# EAGLE design mbc_88_24_01_06_dc (EAGLE 7.6.0)

## Sheet 1 of 2
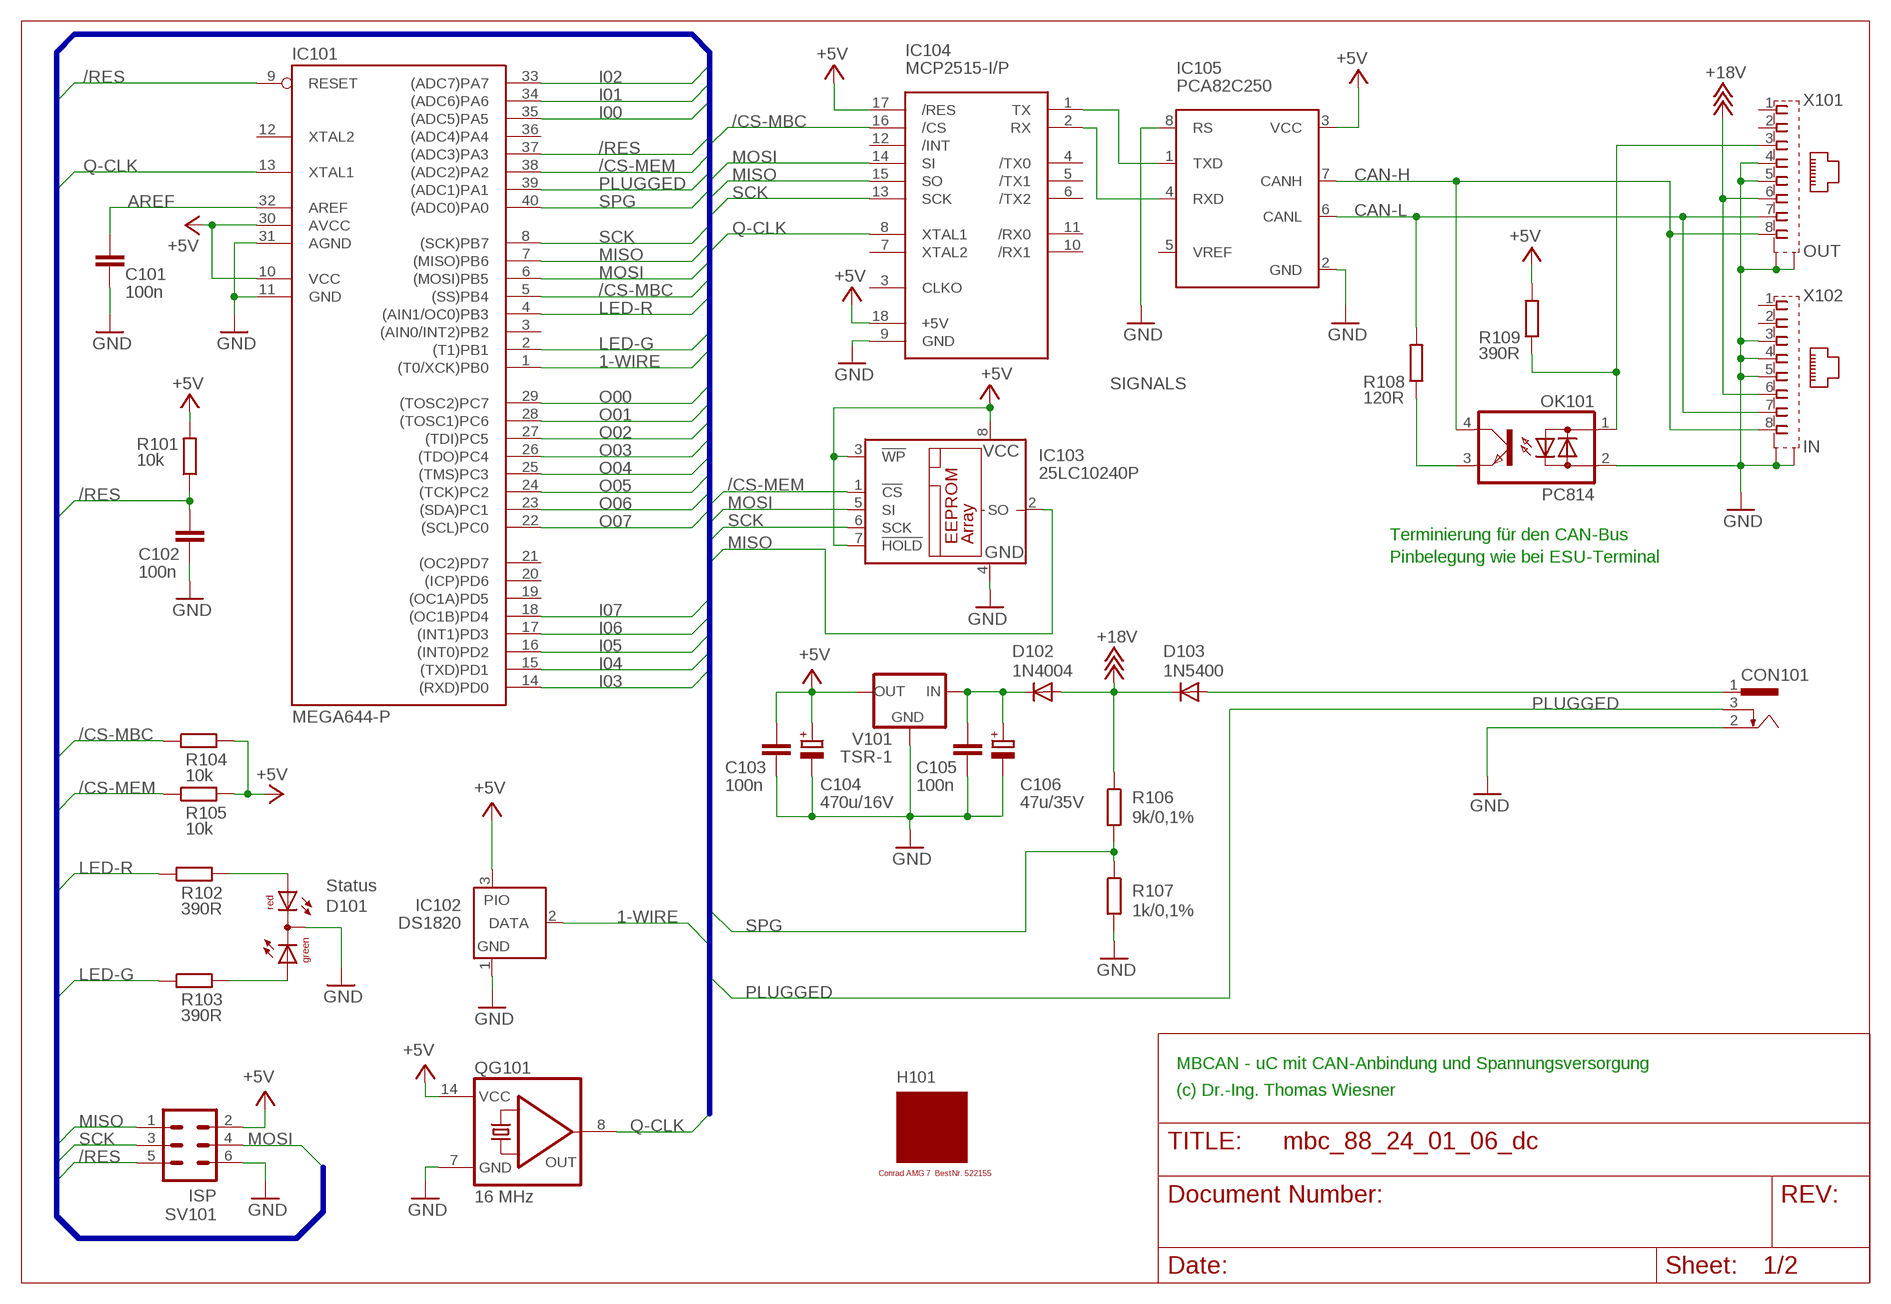
[diagram p0: schematic, sheet 1]

### Parts
C101  100n  C-EU025-025X050  [C025-025X050]
C102  100n  C-EU025-025X050  [C025-025X050]
C103  100n  C-EU025-025X050  [C025-025X050]
C104  470u/16V  CPOL-EUE3.5-8  [E3,5-8]
C105  100n  C-EU025-025X050  [C025-025X050]
C106  47u/35V  CPOL-EUE2.5-7  [E2,5-7]
CON101  POWER-JACK  [POWER-JACK]
D101  Status  DUOLED5MM  [DUOLED5MM]
D102  1N4004  [DO41-10]
D103  1N5400  [DO201-15]
H101  MODULGEHÄUSE-AMG-7  [MODULGEHÄUSE-1]
IC101  MEGA644-P  MEGA323-P  [DIL40]
IC102  DS1820  DS2405  [TO92-]
IC103  25LC10240P  25LC040P  [DIL8]
IC104  MCP2515-I/P  MCP2510-I/P  [DIL18]
IC105  PCA82C250  [DIL08]
OK101  PC814  [DIL04]
QG101  16 MHz  QG5860  [DIL14S]
R101  10k  R-EU_0207/10  [0207/10]
R102  390R  R-EU_0207/10  [0207/10]
R103  390R  R-EU_0207/10  [0207/10]
R104  10k  R-EU_0207/10  [0207/10]
R105  10k  R-EU_0207/10  [0207/10]
R106  9k/0,1%  R-EU_0207/10  [0207/10]
R107  1k/0,1%  R-EU_0207/10  [0207/10]
R108  120R  R-EU_0207/10  [0207/10]
R109  390R  R-EU_0207/10  [0207/10]
SV101  ISP  ML6  [ML6]
V101  TSR-1  [TRACO-TSR-1]
X101  OUT  0446200002  [0446200002]
X102  IN  0446200002  [0446200002]

### Nets
1-WIRE: IC101.1((T0/XCK)PB0) IC102.2(DATA)
+5V: C103.1 C104.+ IC101.10(VCC) IC101.30(AVCC) IC102.3(PIO) IC103.3(!WP) IC103.7(!HOLD) IC103.8(VCC) IC104.17(/RES) IC104.18(+5V) IC105.3(VCC) QG101.14(VCC) R101.2 R104.2 R105.2 R109.2 SV101.2 V101.OUT ; also sheet 2
+18V: D102.A D103.C R106.1 X101.6 X102.6
/CS-MBC: IC101.5((SS)PB4) IC104.16(/CS) R104.1
/CS-MEM: IC101.38((ADC2)PA2) IC103.1(!CS) R105.1
/RES: C102.1 IC101.9(RESET) IC101.37((ADC3)PA3) R101.1 SV101.5
AREF: C101.1 IC101.32(AREF)
CAN-H: IC105.7(CANH) OK101.4(C) X101.8 X102.8
CAN-L: IC105.6(CANL) R108.2 X101.7 X102.7
GND: C101.2 C102.2 C103.2 C104.- C105.2 C106.- CON101.2 D101.K(C) IC101.11(GND) IC101.31(AGND) IC102.1(GND) IC103.4(GND) IC104.9(GND) IC105.2(GND) IC105.8(RS) OK101.2(AC2) QG101.7(GND) R107.2 SV101.6 V101.GND X101.4 X101.5 X101.S@1(S1) X101.S@2(S2) X102.3 X102.4 X102.5 X102.S@1(S1) X102.S@2(S2) ; also sheet 2
I00: IC101.35((ADC5)PA5) ; also sheet 2
I01: IC101.34((ADC6)PA6) ; also sheet 2
I02: IC101.33((ADC7)PA7) ; also sheet 2
I03: IC101.14((RXD)PD0) ; also sheet 2
I04: IC101.15((TXD)PD1) ; also sheet 2
I05: IC101.16((INT0)PD2) ; also sheet 2
I06: IC101.17((INT1)PD3) ; also sheet 2
I07: IC101.18((OC1B)PD4) ; also sheet 2
LED-G: IC101.2((T1)PB1) R103.1
LED-R: IC101.4((AIN1/OC0)PB3) R102.1
MISO: IC101.7((MISO)PB6) IC103.2(SO) IC104.15(SO) SV101.1
MOSI: IC101.6((MOSI)PB5) IC103.5(SI) IC104.14(SI) SV101.4
N$1: IC104.1(TX) IC105.1(TXD)
N$2: IC104.2(RX) IC105.4(RXD)
N$3: OK101.1(AC1) R109.1 X101.3
N$5: OK101.3(E) R108.1
N$6: C105.1 C106.+ D102.C V101.IN
N$9: D101.AR R102.2
N$13: D101.AG R103.2
O00: IC101.29((TOSC2)PC7) ; also sheet 2
O01: IC101.28((TOSC1)PC6) ; also sheet 2
O02: IC101.27((TDI)PC5) ; also sheet 2
O03: IC101.26((TDO)PC4) ; also sheet 2
O04: IC101.25((TMS)PC3) ; also sheet 2
O05: IC101.24((TCK)PC2) ; also sheet 2
O06: IC101.23((SDA)PC1) ; also sheet 2
O07: IC101.22((SCL)PC0) ; also sheet 2
PLUGGED: CON101.3 IC101.39((ADC1)PA1)
Q-CLK: IC101.13(XTAL1) IC104.8(XTAL1) QG101.8(OUT)
SCK: IC101.8((SCK)PB7) IC103.6(SCK) IC104.13(SCK) SV101.3
SPG: IC101.40((ADC0)PA0) R106.2 R107.1
V-NETZTEIL1: CON101.1 D103.A
Unconnected: IC101.3((AIN0/INT2)PB2) IC101.12(XTAL2) IC101.19((OC1A)PD5) IC101.20((ICP)PD6) IC101.21((OC2)PD7) IC101.36((ADC4)PA4) IC104.3(CLKO) IC104.4(/TX0) IC104.5(/TX1) IC104.6(/TX2) IC104.7(XTAL2) IC104.10(/RX1) IC104.11(/RX0) IC104.12(/INT) IC105.5(VREF) X101.1 X101.2 X102.1 X102.2

### Buses
SIGNALS

### Notes on the sheet
- Terminierung für den CAN-Bus
- Pinbelegung wie bei ESU-Terminal
- MBCAN - uC mit CAN-Anbindung und Spannungsversorgung
- (c) Dr.-Ing. Thomas Wiesner

## Sheet 2 of 2
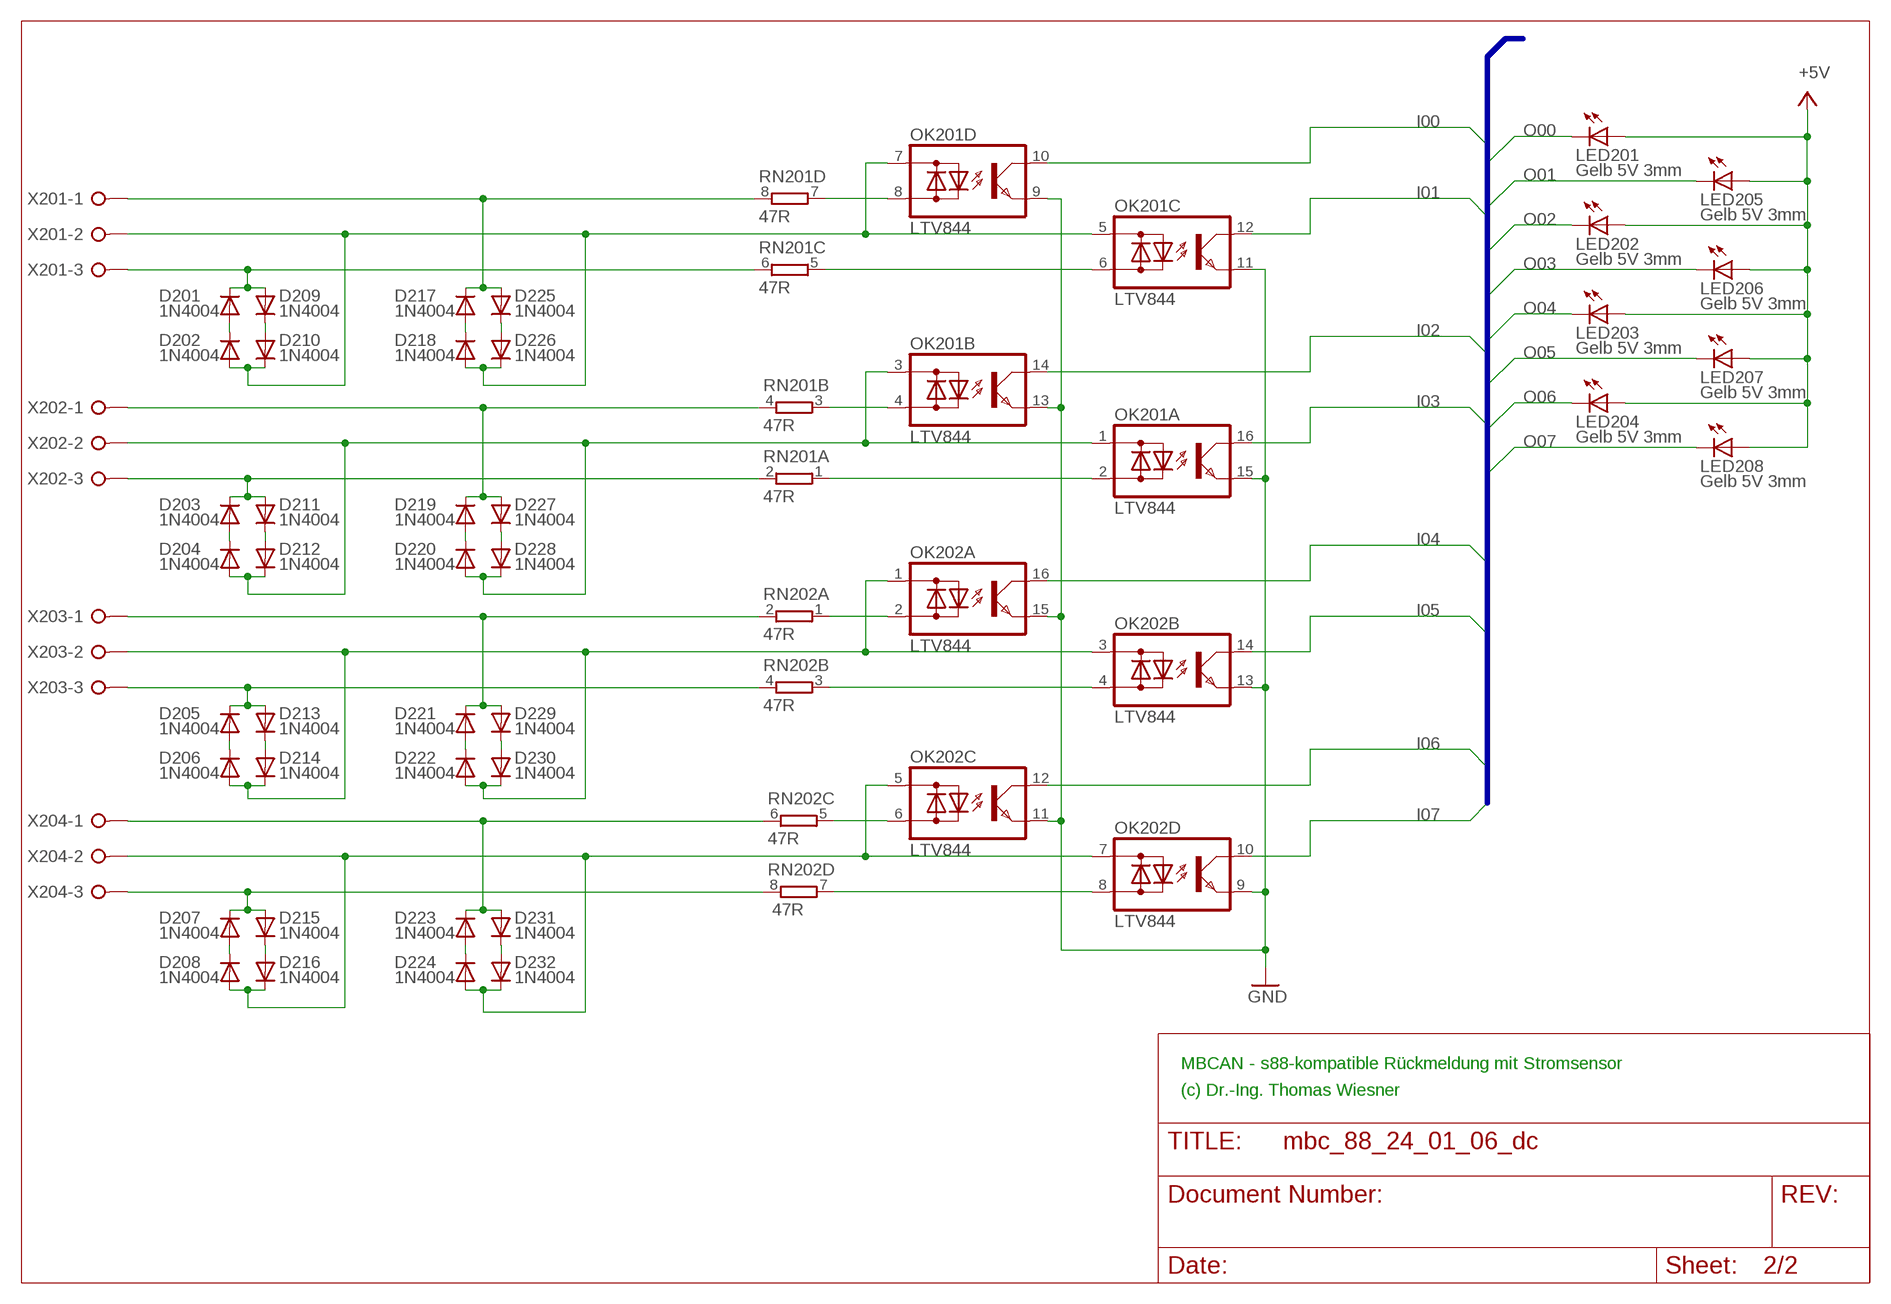
[diagram p1: schematic, sheet 2]

### Parts
D201  1N4004  [DO41-10]
D202  1N4004  [DO41-10]
D203  1N4004  [DO41-10]
D204  1N4004  [DO41-10]
D205  1N4004  [DO41-10]
D206  1N4004  [DO41-10]
D207  1N4004  [DO41-10]
D208  1N4004  [DO41-10]
D209  1N4004  [DO41-10]
D210  1N4004  [DO41-10]
D211  1N4004  [DO41-10]
D212  1N4004  [DO41-10]
D213  1N4004  [DO41-10]
D214  1N4004  [DO41-10]
D215  1N4004  [DO41-10]
D216  1N4004  [DO41-10]
D217  1N4004  [DO41-10]
D218  1N4004  [DO41-10]
D219  1N4004  [DO41-10]
D220  1N4004  [DO41-10]
D221  1N4004  [DO41-10]
D222  1N4004  [DO41-10]
D223  1N4004  [DO41-10]
D224  1N4004  [DO41-10]
D225  1N4004  [DO41-10]
D226  1N4004  [DO41-10]
D227  1N4004  [DO41-10]
D228  1N4004  [DO41-10]
D229  1N4004  [DO41-10]
D230  1N4004  [DO41-10]
D231  1N4004  [DO41-10]
D232  1N4004  [DO41-10]
LED201  Gelb 5V 3mm  LED3MM  [LED3MM]
LED202  Gelb 5V 3mm  LED3MM  [LED3MM]
LED203  Gelb 5V 3mm  LED3MM  [LED3MM]
LED204  Gelb 5V 3mm  LED3MM  [LED3MM]
LED205  Gelb 5V 3mm  LED3MM  [LED3MM]
LED206  Gelb 5V 3mm  LED3MM  [LED3MM]
LED207  Gelb 5V 3mm  LED3MM  [LED3MM]
LED208  Gelb 5V 3mm  LED3MM  [LED3MM]
OK201  LTV844  TIL196  [DIL16]
OK202  LTV844  TIL196  [DIL16]
RN201  47R  E4R  [SIL8]
RN202  47R  E4R  [SIL8]
X201  W237-03P  [W237-133]
X202  W237-03P  [W237-133]
X203  W237-03P  [W237-133]
X204  W237-03P  [W237-133]

### Nets
+5V: LED201.A LED202.A LED203.A LED204.A LED205.A LED206.A LED207.A LED208.A ; also sheet 1
GND: OK201.9(D:E) OK201.11(C:E) OK201.13(B:E) OK201.15(A:E) OK202.9(D:E) OK202.11(C:E) OK202.13(B:E) OK202.15(A:E) ; also sheet 1
I00: OK201.10(D:C) ; also sheet 1
I01: OK201.12(C:C) ; also sheet 1
I02: OK201.14(B:C) ; also sheet 1
I03: OK201.16(A:C) ; also sheet 1
I04: OK202.16(A:C) ; also sheet 1
I05: OK202.14(B:C) ; also sheet 1
I06: OK202.12(C:C) ; also sheet 1
I07: OK202.10(D:C) ; also sheet 1
N$11: D201.A D202.C
N$12: D201.C D209.A RN201.6 X201.3
N$15: D217.A D218.C
N$16: D225.C D226.A
N$17: D217.C D225.A RN201.8 X201.1
N$18: D202.A D210.C D218.A D226.C OK201.5(C:AC1) OK201.7(D:AC1) X201.2
N$19: D203.A D204.C
N$20: D209.C D210.A
N$21: D211.C D212.A
N$22: D203.C D211.A RN201.2 X202.3
N$31: D219.A D220.C
N$32: D227.C D228.A
N$33: D219.C D227.A RN201.4 X202.1
N$34: D204.A D212.C D220.A D228.C OK201.1(A:AC1) OK201.3(B:AC1) X202.2
N$35: D205.A D206.C
N$36: D213.C D214.A
N$37: D205.C D213.A RN202.4 X203.3
N$39: D221.A D222.C
N$40: D229.C D230.A
N$41: D221.C D229.A RN202.2 X203.1
N$42: OK202.8(D:AC2) RN202.7
N$43: OK202.6(C:AC2) RN202.5
N$44: OK202.4(B:AC2) RN202.3
N$45: OK202.2(A:AC2) RN202.1
N$46: OK201.2(A:AC2) RN201.1
N$48: OK201.4(B:AC2) RN201.3
N$49: D206.A D214.C D222.A D230.C OK202.1(A:AC1) OK202.3(B:AC1) X203.2
N$50: D207.A D208.C
N$51: D215.C D216.A
N$52: D207.C D215.A RN202.8 X204.3
N$54: D223.A D224.C
N$55: D231.C D232.A
N$56: D223.C D231.A RN202.6 X204.1
N$57: D208.A D216.C D224.A D232.C OK202.5(C:AC1) OK202.7(D:AC1) X204.2
N$64: OK201.6(C:AC2) RN201.5
N$65: OK201.8(D:AC2) RN201.7
O00: LED201.K(C) ; also sheet 1
O01: LED205.K(C) ; also sheet 1
O02: LED202.K(C) ; also sheet 1
O03: LED206.K(C) ; also sheet 1
O04: LED203.K(C) ; also sheet 1
O05: LED207.K(C) ; also sheet 1
O06: LED204.K(C) ; also sheet 1
O07: LED208.K(C) ; also sheet 1

### Buses
B$1

### Notes on the sheet
- MBCAN - s88-kompatible Rückmeldung mit Stromsensor
- (c) Dr.-Ing. Thomas Wiesner

## Library data of the parts
C101-C103 C105 = rcl:C-EU: CAPACITOR, European symbol
C104 C106 = rcl:CPOL-EU: POLARIZED CAPACITOR, European symbol
CON101 = mbc:POWER-JACK: Power-Stecker für 2,5 mm Hohlbuchse
D101 = led:DUOLED5MM: DUO LED 2 colors, 5 mm, round
D102 D201-D232 = diode:1N4004: DIODE general purpose rectifier, 1 A
D103 = diode:1N5400: DIODE standard rectifier, 3 A, 50 V (Motorola)
H101 = mbc:MODULGEHÄUSE-AMG-7: Gehäuse Conrad AMG 7 BestNr. 522155
IC101 = atmel:MEGA323-P: MICROCONTROLLER 32 Kbytes FLASH 2 Kbytes SRAM 1 Kbytes EEPROM USART 8-channel 10 bit ADC Source: avr.lbr; OC_FARNELL: unknown; OC_NEWARK: unknown
IC102 = maxim:DS2405: Addressable Switch DALLAS Semiconductor; MF: DALLAS SEMICONDUCTOR; MPN: DS2405; OC_FARNELL: 1188025; OC_NEWARK: 06F4645
IC103 = microchip:25*: Serial EEPROM 4K/ 8K , SPI bus; MF: MICROCHIP; MPN: 25LC040/P; OC_FARNELL: 9758100; OC_NEWARK: 96K4091
IC104 = mbc:MCP2510: BASIC-CAN 2.0a Controller Stand-alone CAN controller von Microchip
IC105 = micro-philips:PCA82C250: CAN CONTROLLER INTERFACE; OC_FARNELL: 3692358; OC_NEWARK: unknown
LED201-LED208 = led:LED: LED OSRAM: - CHIPLED LG R971, LG N971, LY N971, LG Q971, LY Q971, LO R971, LY R971 LH N974, LH R974 LS Q976, LO Q976, LY Q976 LO Q996 - Hyper CHIPLED LW Q18S LB Q993, LB Q99A, LB R99A - SideLED LS A670, LO A670, LY A670, LG A670, LP A670 LB A673, LV A673, LT A673, LW A673 LH A674 LY A675 LS A676, LA A676, LO A676, LY A676, LW A676 LS A679, LY A679, LG A679 - Hyper Micro SIDELED® LS Y876, LA Y876, LO Y876, LY Y876 LT Y87S - SmartLED LW L88C, LW L88S LB L89C, LB L89S, LG L890 LS L89K, LO L89K, LY L89K LS L896, LA L896, LO L896, LY L896 - TOPLED LS T670, LO T670, LY T670, LG T670, LP T670 LSG T670, LSP T670, LSY T670, LOP T670, LYG T670 LG T671, LOG T671, LSG T671 LB T673, LV T673, LT T673, LW T673 LH T674 LS T676, LA T676, LO T676, LY T676, LB T676, LH T676, LSB T676, LW T676 LB T67C, LV T67C, LT T67C, LS T67K, LO T67K, LY T67K, LW E67C LS E67B, LA E67B, LO E67B, LY E67B, LB E67C, LV E67C, LT E67C LW T67C LS T679, LY T679, LG T679 LS T770, LO T770, LY T770, LG T770, LP T770 LB T773, LV T773, LT T773, LW T773 LH T774 LS E675, LA E675, LY E675, LS T675 LS T776, LA T776, LO T776, LY T776, LB T776 LHGB T686 LT T68C, LB T68C - Hyper Mini TOPLED® LB M676 - Mini TOPLED Santana® LG M470 LS M47K, LO M47K, LY M47K Source: http://www.osram.convergy.de LUXEON: - LUMILED® LXK2-PW12-R00, LXK2-PW12-S00, LXK2-PW14-U00, LXK2-PW14-V00 LXK2-PM12-R00, LXK2-PM12-S00, LXK2-PM14-U00 LXK2-PE12-Q00, LXK2-PE12-R00, LXK2-PE12-S00, LXK2-PE14-T00, LXK2-PE14-U00 LXK2-PB12-K00, LXK2-PB12-L00, LXK2-PB12-M00, LXK2-PB14-N00, LXK2-PB14-P00, LXK2-PB14-Q00 LXK2-PR12-L00, LXK2-PR12-M00, LXK2-PR14-Q00, LXK2-PR14-R00 LXK2-PD12-Q00, LXK2-PD12-R00, LXK2-PD12-S00 LXK2-PH12-R00, LXK2-PH12-S00 LXK2-PL12-P00, LXK2-PL12-Q00, LXK2-PL12-R00 Source: www.luxeon.com KINGBRIGHT: KA-3528ASYC Source: www.kingbright.com
OK101 = optocoupler:PC814: SHARP OPTO COUPLER; OC_FARNELL: 9707662; OC_NEWARK: unknown
OK201 OK202 = optocoupler:TIL196: TEXAS INSTRUMENTS OPTO COUPLER; MPN: TIL 196; OC_FARNELL: 1683367; OC_NEWARK: 05R6476
QG101 = crystal:QG5860: CRYSTAL RESONATOR; OC_FARNELL: unknown; OC_NEWARK: unknown
R101-R109 = resistor:R-EU_: RESISTOR, European symbol
RN201 RN202 = resistor-sil:E4R: SIL RESISTOR; OC_FARNELL: unknown; OC_NEWARK: unknown
SV101 = con-ml:ML6: HARTING; OC_FARNELL: unknown; OC_NEWARK: unknown
V101 = mbc:TSR-1: Spannungsregler Hersteller: TRACO Typ: TSR-1 5V: TSR 1-2450 Spg: 5V Strom: 1A Reichelt TSR 1-2450
X101 X102 = mbc:0446200002: RJ-45 INVERTED MODULAR JACK ASSEMBLY WITH RJ-11 KEEPOUT FEATURE Source: Data sheet <http://www.farnell.com/datasheets/73207.pdf> MOLEX 0446200002 BUCHSE, RJ45, GESCHIRMT Source: Farnell <http://de.farnell.com/molex/0446200002/buchse-rj45-geschirmt/dp/9251910?ost=9251910>; MF: MOLEX; MPN: 0446200002; OC_FARNELL: 9251910
X201-X204 = con-wago-508:W237-03P: WAGO SREW CLAMP; OC_FARNELL: unknown; OC_NEWARK: unknown

## Board
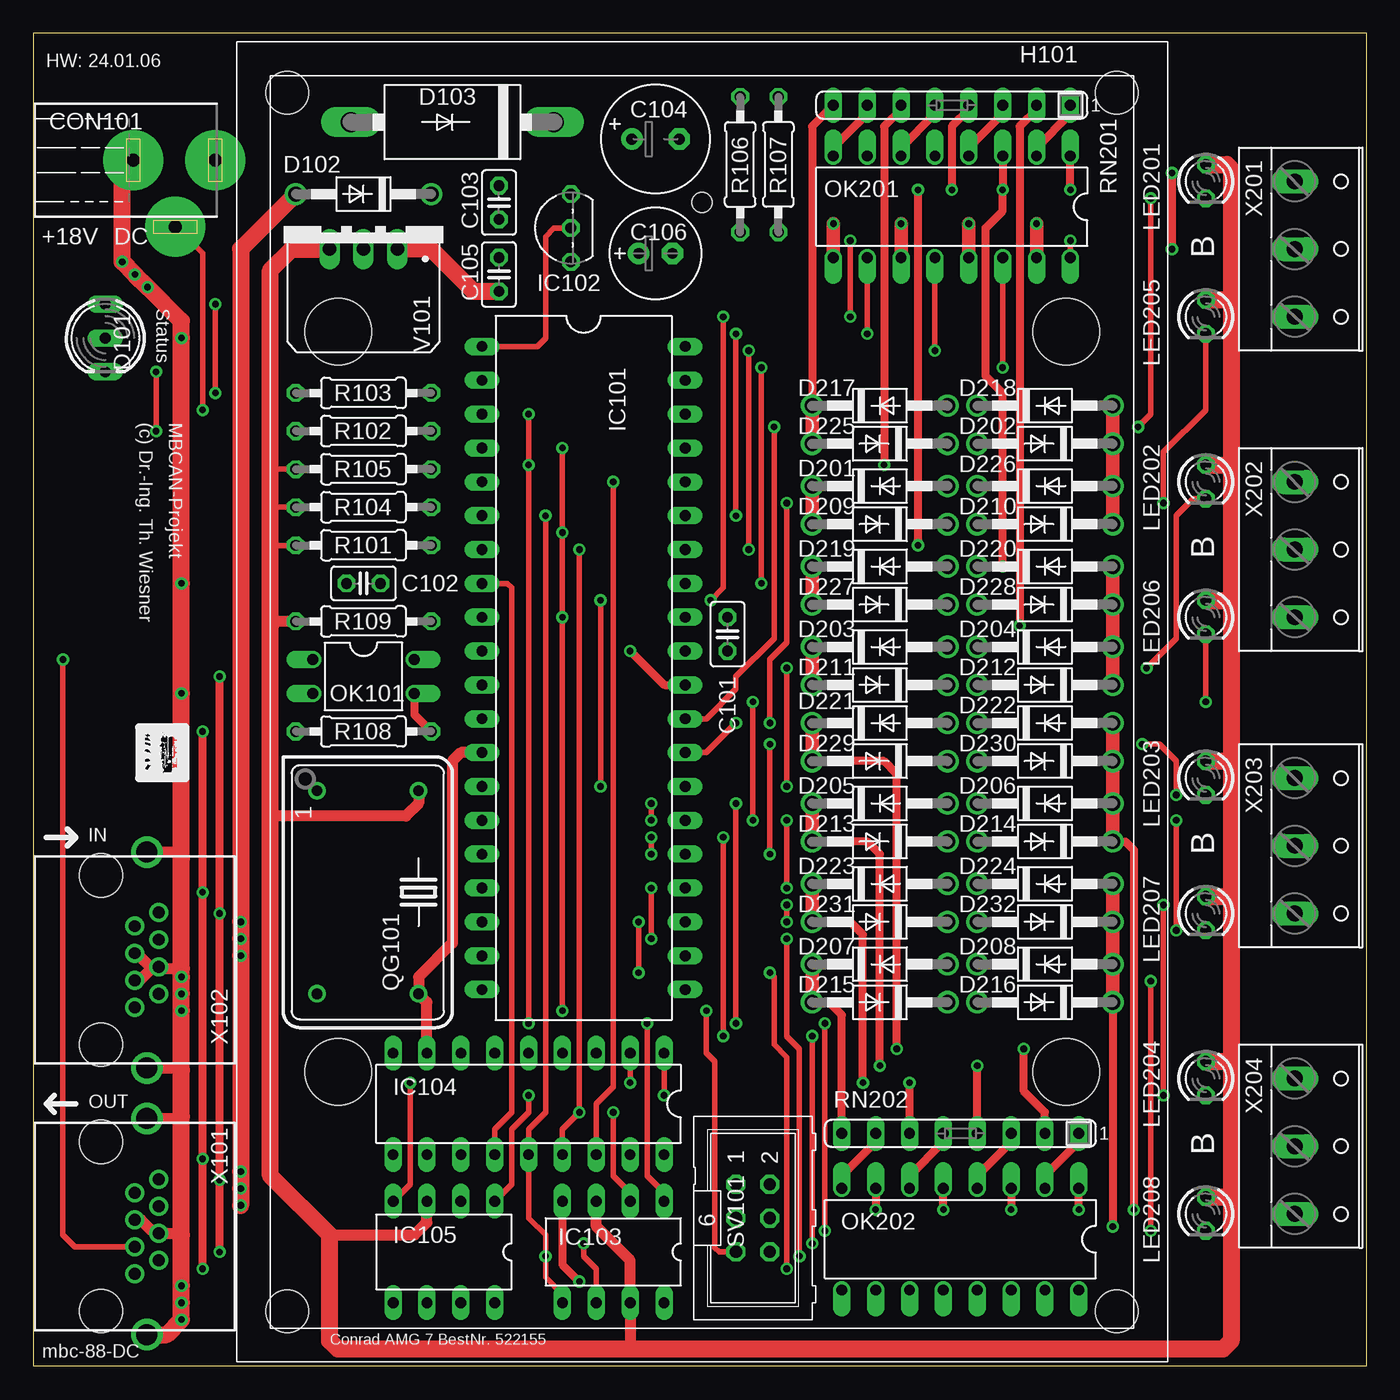
[diagram p2: board, top side]
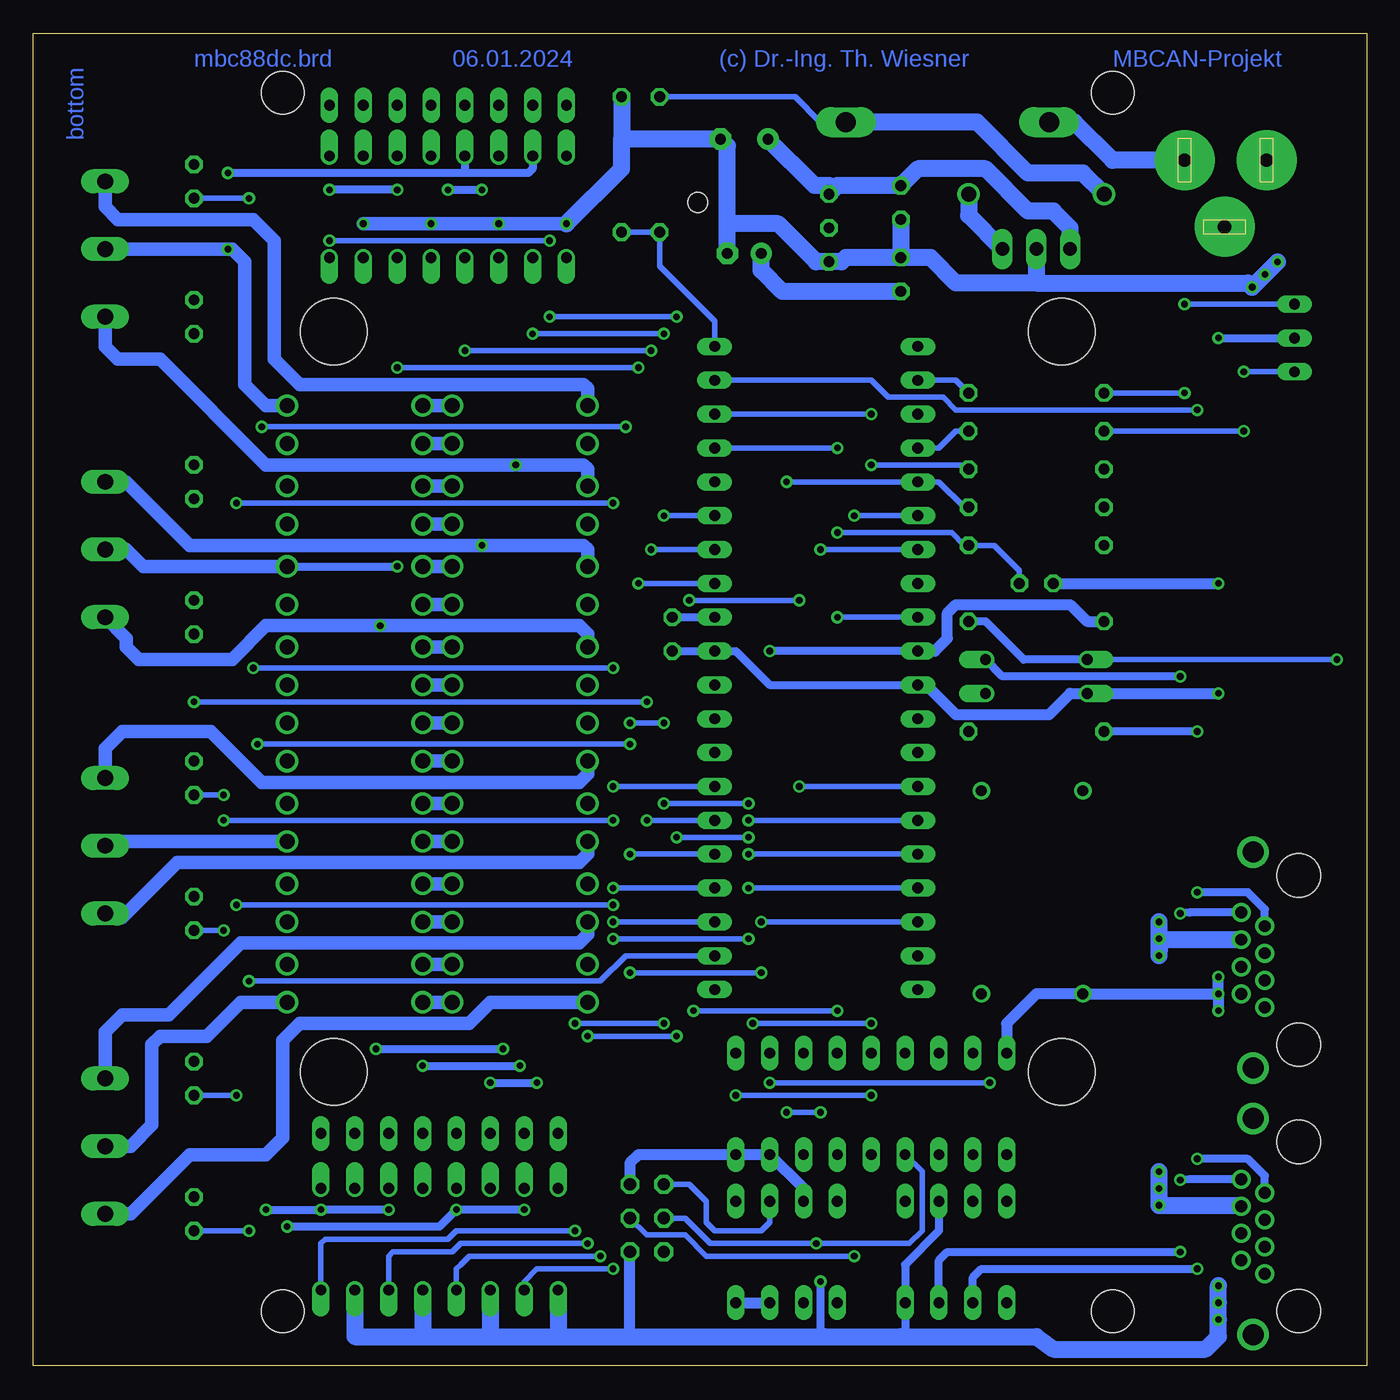
[diagram p3: board, bottom side, seen from below]

Size 100 x 99.99 mm. Coordinates in mm from the lower left corner, seen from the top.
Outline: 0,99.99 0,0 100,0 100,99.99 0,99.99
Copper layers (1*16): Top 0.035mm / dielectric 1.5mm / Bottom 0.035mm
Design rules "default *": minimum track width 10mil, minimum drill 0.5mm, track to track 8mil, track to pad 8mil, pad to pad 8mil, via to via 8mil, smd to smd 8mil, copper to edge 40mil, drill to drill 8mil, minimum pad ring 10mil, minimum via ring 8mil, stop-mask expansion 4mil, vias tented up to drill 0mil, thermal gap 10mil

### Footprints (pad centres in the part's own frame; a part is rotated, then mirrored left to right if it is on the bottom)
C025-025X050 = drill 0.813 octagon: 1 -1.27,0; 2 1.27,0
E3,5-8 = drill 0.813 pad 1.6: + -1.778,0 | drill 0.813 pad 1.6 octagon: - 1.778,0
E2,5-7 = drill 0.813 pad 1.6: + -1.27,0 | drill 0.813 pad 1.6 octagon: - 1.27,0
POWER-JACK = drill 1 pad 4.5: 1 0,6.03; 2 0,-0.12; 3 5,3.03
DUOLED5MM = drill 0.813 long: AG -2.54,0; AR 2.54,0; K 0,0
DO41-10 = drill 1.118: A 5.08,0; C -5.08,0
DO201-15 = drill 1.499 long: A 7.62,0; C -7.62,0
MODULGEHÄUSE-1 = hole 3.2: -45.72,-31.115; -45.72,31.115; 45.72,31.115; 45.72,-31.115 | hole 5: -27.781,-27.305; 27.781,-27.305; -27.781,27.305; 27.781,27.305 | hole 1.5: -37.465,0
DIL40 = drill 0.813 long: 1 -24.13,-7.62; 2 -21.59,-7.62; 3 -19.05,-7.62; 4 -16.51,-7.62; 5 -13.97,-7.62; 6 -11.43,-7.62; 7 -8.89,-7.62; 8 -6.35,-7.62; 9 -3.81,-7.62; 10 -1.27,-7.62; 11 1.27,-7.62; 12 3.81,-7.62; 13 6.35,-7.62; 14 8.89,-7.62; 15 11.43,-7.62; 16 13.97,-7.62; 17 16.51,-7.62; 18 19.05,-7.62; 19 21.59,-7.62; 20 24.13,-7.62; 21 24.13,7.62; 22 21.59,7.62; 23 19.05,7.62; 24 16.51,7.62; 25 13.97,7.62; 26 11.43,7.62; 27 8.89,7.62; 28 6.35,7.62; 29 3.81,7.62; 30 1.27,7.62; 31 -1.27,7.62; 32 -3.81,7.62; 33 -6.35,7.62; 34 -8.89,7.62; 35 -11.43,7.62; 36 -13.97,7.62; 37 -16.51,7.62; 38 -19.05,7.62; 39 -21.59,7.62; 40 -24.13,7.62
TO92- = drill 0.813 octagon: 1 -2.54,0; 2 0,0; 3 2.54,0
DIL8 = drill 0.813 long: 1 -3.81,-3.81; 2 -1.27,-3.81; 3 1.27,-3.81; 4 3.81,-3.81; 5 3.81,3.81; 6 1.27,3.81; 7 -1.27,3.81; 8 -3.81,3.81
DIL18 = drill 0.813 long: 1 -10.16,-3.81; 2 -7.62,-3.81; 3 -5.08,-3.81; 4 -2.54,-3.81 | drill 0.8 long: 5 0,-3.81; 6 2.54,-3.81; 7 5.08,-3.81; 8 7.62,-3.81; 9 10.16,-3.81; 10 10.16,3.81; 11 7.62,3.81; 12 5.08,3.81; 13 2.54,3.81; 14 0,3.81; 15 -2.54,3.81; 16 -5.08,3.81; 17 -7.62,3.81; 18 -10.16,3.81
DIL08 = drill 0.813 long: 1 -3.81,-3.81; 2 -1.27,-3.81; 3 1.27,-3.81; 4 3.81,-3.81; 5 3.81,3.81; 6 1.27,3.81; 7 -1.27,3.81; 8 -3.81,3.81
LED3MM = drill 0.813 octagon: A -1.27,0; K 1.27,0
DIL04 = drill 0.813 offset: 1 -1.27,-3.81; 2 1.27,-3.81; 3 1.27,3.81; 4 -1.27,3.81
DIL16 = drill 0.813 offset: 1 -8.89,-3.81; 2 -6.35,-3.81; 3 -3.81,-3.81; 4 -1.27,-3.81; 5 1.27,-3.81; 6 3.81,-3.81; 7 6.35,-3.81; 8 8.89,-3.81; 9 8.89,3.81; 10 6.35,3.81; 11 3.81,3.81; 12 1.27,3.81; 13 -1.27,3.81; 14 -3.81,3.81; 15 -6.35,3.81; 16 -8.89,3.81
DIL14S = drill 0.813: 1 -7.62,-3.81; 7 7.62,-3.81; 8 7.62,3.81; 14 -7.62,3.81
0207/10 = drill 0.813 octagon: 1 -5.08,0; 2 5.08,0
SIL8 = drill 0.813 long: 1 -8.89,0; 2 -6.35,0; 3 -3.81,0; 4 -1.27,0; 5 1.27,0; 6 3.81,0; 7 6.35,0; 8 8.89,0
ML6 = drill 0.914 octagon: 1 -2.54,-1.27; 2 -2.54,1.27; 3 0,-1.27; 4 0,1.27; 5 2.54,-1.27; 6 2.54,1.27
TRACO-TSR-1 = drill 1.016 long: GND 0,2.54; IN -2.54,2.54; OUT 2.54,2.54
0446200002 = drill 0.889 pad 1.422: 1 3.556,2.54; 2 2.54,4.318; 3 1.524,2.54; 4 0.508,4.318; 5 -0.508,2.54; 6 -1.524,4.318; 7 -2.54,2.54; 8 -3.556,4.318 | drill 1.575 pad 2.286: S@1 -8.103,3.429; S@2 8.103,3.429 | hole 3.251: 6.35,0; -6.35,0
W237-133 = drill 1.194 long: 1 -5.08,-0.635; 2 0,-0.635; 3 5.08,-0.635

### Placement (x,y rotation side)
C101  52.07,54.91 270 top
C102  24.77,58.72 180 top
C103  34.92,87.29 270 top
C104  46.67,92.06 0 top
C105  34.92,81.9 90 top
C106  46.67,83.48 0 top
CON101  7.62,90.47 270 top
D101  5.4,77.13 270 top
D102  24.77,87.93 180 top
D103  31.43,93.33 180 top
D201  63.5,66.02 0 top
D202  75.88,66.02 0 top
D203  63.5,53.95 0 top
D204  75.88,53.95 0 top
D205  63.5,42.21 0 top
D206  75.88,42.21 0 top
D207  63.5,30.14 0 top
D208  75.88,30.14 0 top
D209  63.5,63.16 180 top
D210  75.88,63.16 180 top
D211  63.5,51.1 180 top
D212  75.88,51.1 180 top
D213  63.5,39.35 180 top
D214  75.88,39.35 180 top
D215  63.5,27.29 180 top
D216  75.88,27.29 180 top
D217  63.5,72.05 0 top
D218  75.88,72.05 0 top
D219  63.5,59.99 0 top
D220  75.88,59.99 0 top
D221  63.5,48.24 0 top
D222  75.88,48.24 0 top
D223  63.5,36.17 0 top
D224  75.88,36.17 0 top
D225  63.5,69.2 180 top
D226  75.88,69.2 180 top
D227  63.5,57.13 180 top
D228  75.88,57.13 180 top
D229  63.5,45.38 180 top
D230  75.88,45.38 180 top
D231  63.5,33.32 180 top
D232  75.88,33.32 180 top
H101  50.16,49.83 270 top
IC101  41.27,52.37 270 top
IC102  40.32,85.39 90 top
IC103  43.5,8.55 180 top
IC104  37.15,19.66 180 top
IC105  30.8,8.55 180 top
LED201  87.95,88.88 270 top
LED202  87.95,66.34 270 top
LED203  87.95,44.11 270 top
LED204  87.95,21.57 270 top
LED205  87.95,78.72 270 top
LED206  87.95,56.18 270 top
LED207  87.95,33.95 270 top
LED208  87.95,11.41 270 top
OK101  24.77,51.73 270 top
OK201  68.9,86.98 180 top
OK202  69.53,9.51 180 top
QG101  25.08,35.54 270 top
R101  24.77,61.57 180 top
R102  24.77,70.15 180 top
R103  24.77,73.01 180 top
R104  24.77,64.43 180 top
R105  24.77,67.29 180 top
R106  53.02,90.15 270 top
R107  55.88,90.15 90 top
R108  24.77,47.6 180 top
R109  24.77,55.86 180 top
RN201  68.9,94.59 180 top
RN202  69.53,17.44 180 top
SV101  53.98,11.09 270 top
V101  24.77,86.34 180 top
X101  5.08,10.46 270 top
X102  5.08,30.46 270 top
X201  95.25,83.8 270 top
X202  95.25,61.26 270 top
X203  95.25,39.03 270 top
X204  95.25,16.49 270 top

### Tracks (layer width: path | path; a pad name or v marks a point on that pad's centre or on a via)
1-WIRE
  Top 0.406: IC102.2 39.05,85.39 38.42,84.75 38.42,77.13 37.78,76.5 IC101.1
+5V  (via drill 0.5)
  Top 0.406: R105.2 17.78,67.29 | R104.2 17.78,64.43 | R101.2 17.78,61.57 | 18.1,55.86 17.78,55.54
  Top 0.61: v44.77,53.64 47.31,51.1 IC101.30
  Top 0.813: R109.2 18.1,55.86 | QG101.14 28.89,42.21 27.94,41.25 17.78,41.25 | IC103.3 42.23,10.46 44.77,7.92 IC103.7 44.77,1.25 | 22.23,9.82 28.57,9.82 29.53,10.78 IC105.3
  Top 1.016: 89.53,22.84 89.85,22.52 | 89.53,45.38 89.85,45.06 | 89.85,13 89.85,12.36 89.53,12.68 89.85,13
  Top 1.27: LED201.A 89.53,90.15 89.85,89.83 89.85,79.99 | 89.85,79.99 89.85,67.61 | 89.85,67.61 89.85,57.45 | 89.85,57.45 89.85,45.06 89.85,35.22 | 89.85,35.22 89.85,22.52 89.85,13 | LED204.A 89.53,22.84 | LED207.A 89.85,35.22 | LED203.A 89.53,45.38 | LED206.A 89.85,57.45 | LED202.A 89.85,67.61 | LED205.A 89.85,79.99 | LED208.A 89.53,12.68 | 89.85,12.36 89.85,1.89 89.22,1.25 44.77,1.25 22.86,1.25 22.23,1.89 22.23,9.82 17.78,14.27 17.78,41.25 17.78,55.54 17.78,61.57 17.78,64.43 17.78,67.29 17.78,82.21 19.37,83.8 V101.OUT
  Bottom 0.61: IC101.10 v44.77,53.64
  Bottom 0.813: IC101.10 32.38,53.64 31.43,54.59 31.43,56.49 30.8,57.13 22.23,57.13 20.95,55.86 R109.2 | SV101.2 55.24,15.22 54.61,15.86 IC104.18 IC104.17 42.23,13.32 IC103.3 | IC103.8 IC103.7
  Bottom 1.27: C104.+ 41.4,88.56 40.32,88.56 IC102.3 39.69,88.56 C103.1 33.66,89.83 28.57,89.83 25.4,86.66 23.5,86.66 22.23,85.39 V101.OUT
+18V  (via drill 0.5)
  Top 1.27: D102.A 15.56,83.8 v15.56,33.32 v15.56,32.05 v15.56,30.78 v15.56,14.59 v15.56,13.32 v15.56,12.04
  Bottom 0.406: D103.C 40.96,93.33 42.86,95.23 R106.1
  Bottom 1.27: D102.A 21.27,89.52 25.4,89.52 29.21,93.33 D103.C | X101.6 9.46,12.04 v15.56,12.04 v15.56,14.59 | X102.6 15.49,31.98 v15.56,32.05 | v15.56,32.05 15.56,32.68 | v15.56,32.05 15.56,31.09 | v15.56,30.78 v15.56,33.32
/CS-MBC  (via drill 0.5)
  Top 0.406: IC104.16 42.23,19.66 43.5,20.93 v43.5,66.34
  Bottom 0.406: v43.5,66.34 IC101.5 32.07,66.34 30.16,64.43 R104.1
/CS-MEM  (via drill 0.5)
  Top 0.406: IC103.1 47.31,13 46.04,14.27 v46.04,25.7 | v37.15,25.7 v37.15,67.61 v37.15,71.42
  Bottom 0.406: v46.04,25.7 v37.15,25.7 | v37.15,67.61 30.16,67.61 R105.1 | IC101.38 v37.15,71.42
/RES  (via drill 0.5)
  Top 0.406: SV101.5 51.44,8.55 51.12,8.87 51.12,22.84 50.48,23.48 v50.48,26.65 | v39.69,26.65 v39.69,56.18 v39.69,62.53 v39.69,68.88
  Bottom 0.406: v50.48,26.65 v39.69,26.65 | v39.69,56.18 IC101.9 | v39.69,62.53 31.11,62.53 30.16,61.57 R101.1 27.94,61.57 26.04,59.67 C102.1 | IC101.37 v39.69,68.88
AREF
  Bottom 0.61: C101.1 IC101.32
CAN-H  (via drill 0.5)
  Top 0.61: v13.97,8.55 v13.97,13.95 v13.97,33.95 v13.97,51.73
  Bottom 0.61: IC105.7 32.07,7.92 31.43,8.55 v13.97,8.55 | v13.97,51.73 27.3,51.73 OK101.4 | X102.8 13.27,34.02 v13.97,33.95 | X101.8 13.27,14.01 v13.97,13.95
CAN-L  (via drill 0.5)
  Top 0.61: v12.7,7.28 v12.7,15.54 v12.7,35.54 v12.7,47.6
  Bottom 0.61: IC105.6 29.53,6.65 28.89,7.28 v12.7,7.28 | v12.7,47.6 R108.2 | X102.7 7.62,34.27 8.89,35.54 v12.7,35.54 | X101.7 7.62,14.27 8.89,15.54 v12.7,15.54
GND  (via drill 0.5)
  Top 0.61: IC103.4 39.69,7.6 v40.96,6.33
  Top 0.813: X102.S@1 10.63,38.56 11.11,38.08 | X102.S@2 10.96,22.36 11.11,22.21 | X101.S@1 10.96,18.56 11.11,18.71 | X101.5 8.06,10.97 8.89,10.14 9.21,10.14 X101.4 10.99,9.95 11.11,9.82 | X102.5 7.75,30.97 8.89,29.82 | 8.89,29.82 9.27,29.82 | 9.27,29.82 X102.4 | X102.3 8,28.94 8.89,29.82 | 9.27,29.82 11.11,29.82
  Top 1.016: OK201.15 v75.25,85.7 | OK201.13 v70.17,85.7 | OK201.11 v65.09,85.7 | OK201.9 v60.01,85.7
  Top 1.27: X101.S@2 9.99,2.35 v11.11,3.47 v11.11,4.74 v11.11,6.01 11.11,9.82 11.11,18.71 11.11,22.21 v11.11,26.65 v11.11,27.92 v11.11,29.19 11.11,29.82 11.11,38.08 v11.11,50.46 v11.11,58.72 v11.11,77.13 11.11,78.4 v8.57,80.94 v7.62,81.9 v6.67,82.85 6.67,89.64 CON101.2
  Bottom 0.61: v11.11,77.13 D101.K | C101.2 IC101.31 47.31,53.64 44.77,51.1 IC101.11 | 34.92,2.2 34.61,2.52 IC105.8 34.61,7.6 32.07,10.14 IC105.2 | v40.96,6.33 40.96,2.52 40.64,2.2
  Bottom 0.813: 55.24,2.2 SV101.6 | C102.2 v11.11,58.72 | v11.11,27.92 QG101.7 24.77,27.92 26.99,25.7 IC104.9 | v11.11,27.92 v11.11,29.19 | v11.11,27.92 v11.11,26.65 | v11.11,50.46 OK101.2 22.23,50.46 23.81,48.88 30.8,48.88 33.02,51.1 IC101.11
  Bottom 1.016: v75.25,85.7 v70.17,85.7 v65.09,85.7 v60.01,85.7
  Bottom 1.27: C106.- 47.94,85.7 | 47.94,85.7 47.94,91.55 C104.- 55.88,92.06 | R107.2 55.88,92.06 | v60.01,85.7 55.88,89.83 55.88,92.06 | C103.2 C105.2 | C105.2 39.05,83.17 39.37,82.85 IC102.1 41.27,82.85 44.13,85.7 47.94,85.7 | V101.GND 24.77,81.26 | 24.77,81.26 30.8,81.26 32.7,83.17 C105.2 | OK202.15 75.88,2.2 70.8,2.2 | 70.8,2.2 65.72,2.2 | 65.72,2.2 60.64,2.2 | 60.64,2.2 55.24,2.2 40.64,2.2 34.92,2.2 24.77,2.2 23.5,1.25 12.06,1.25 11.11,2.2 v11.11,3.47 v11.11,4.74 v11.11,6.01 | OK202.9 60.64,2.2 | OK202.11 65.72,2.2 | OK202.13 70.8,2.2 | 24.77,81.26 8.89,81.26 v8.57,80.94 v7.62,81.9 v6.67,82.85
I00  (via drill 0.5)
  Top 0.406: v52.7,63.8 v52.7,77.45 | v62.55,77.45 OK201.10
  Bottom 0.406: IC101.35 v52.7,63.8 | v52.7,77.45 v62.55,77.45
I01  (via drill 0.5)
  Top 0.406: v53.66,61.26 v53.66,76.18 | v67.63,76.18 OK201.12
  Bottom 0.406: IC101.34 v53.66,61.26 | v53.66,76.18 v67.63,76.18
I02  (via drill 0.5)
  Top 0.406: v54.61,58.72 v54.61,74.91 | v72.71,74.91 OK201.14
  Bottom 0.406: IC101.33 v54.61,58.72 | v54.61,74.91 v72.71,74.91
I03  (via drill 0.5)
  Top 0.406: OK201.16 v77.79,84.44 | v61.28,84.44 v61.28,78.72 | v51.75,78.72 51.75,58.4 v50.8,57.45 | v42.55,57.45 v42.55,43.48
  Bottom 0.406: v77.79,84.44 v61.28,84.44 | v61.28,78.72 v51.75,78.72 | v50.8,57.45 v42.55,57.45 | v42.55,43.48 IC101.14
I04  (via drill 0.5)
  Top 0.406: v59.37,10.14 v59.37,25.7 | v52.7,25.7 v52.7,42.21 | v46.35,42.21 v46.35,40.94
  Bottom 0.406: OK202.16 78.42,9.19 78.11,9.51 68.9,9.51 68.26,10.14 v59.37,10.14 | v59.37,25.7 v52.7,25.7 | v52.7,42.21 v46.35,42.21 | v46.35,40.94 IC101.15
I05  (via drill 0.5)
  Top 0.406: v58.42,9.19 v58.42,24.75 | v51.75,24.75 v51.75,39.67 | v46.35,39.67 v46.35,38.4
  Bottom 0.406: OK202.14 73.34,8.24 73.03,8.55 68.58,8.55 67.94,9.19 v58.42,9.19 | v58.42,24.75 v51.75,24.75 | v51.75,39.67 v46.35,39.67 | v46.35,38.4 IC101.16
I06  (via drill 0.5)
  Top 0.406: v57.47,8.24 57.47,23.79 56.52,24.75 v56.52,32.05 | v46.35,32.05 v46.35,35.86
  Bottom 0.406: OK202.12 68.26,7.28 67.94,7.6 67.31,8.24 v57.47,8.24 | v56.52,32.05 v46.35,32.05 | v46.35,35.86 IC101.17
I07  (via drill 0.5)
  Top 0.406: v56.52,7.28 56.52,23.16 55.56,24.11 55.56,29.19 v55.24,29.51 | v45.4,29.51 v45.4,33.32
  Bottom 0.406: OK202.10 63.18,6.33 62.23,7.28 v56.52,7.28 | v55.24,29.51 v45.4,29.51 | v45.4,33.32 IC101.18
LED-G
  Bottom 0.406: IC101.2 30.8,73.96 R103.1
LED-R
  Bottom 0.406: R102.1 30.8,70.15 32.07,68.88 IC101.4
MISO  (via drill 0.5)
  Top 0.406: IC104.15 39.69,17.76 v40.96,19.03 v40.96,61.26 | IC103.2 44.77,13 43.5,14.27 v43.5,19.03
  Bottom 0.406: v40.96,61.26 IC101.7 | v43.5,19.03 v40.96,19.03 | SV101.1 50.8,13.63 49.53,12.36 49.53,10.78 48.9,10.14 45.4,10.14 44.77,10.78 IC103.2
MOSI  (via drill 0.5)
  Top 0.406: v38.42,63.8 38.42,19.03 37.15,17.76 IC104.14 37.15,11.09 38.42,9.82 v38.42,8.24 38.42,6.65 39.69,5.38 IC103.5
  Bottom 0.406: v38.42,63.8 IC101.6 | SV101.4 53.98,9.82 51.12,9.82 49.53,8.24 v38.42,8.24
N$1  (via drill 0.5)
  Top 0.406: IC104.1 v47.31,20.3 | v37.15,20.3 37.15,19.03 35.88,17.76 35.88,13.63 IC105.1
  Bottom 0.406: v47.31,20.3 v37.15,20.3
N$2  (via drill 0.5)
  Top 0.406: IC104.2 v44.77,21.25 | v28.26,21.25 28.26,13.63 IC105.4
  Bottom 0.406: v44.77,21.25 v28.26,21.25
N$3  (via drill 0.5)
  Top 0.406: X101.3 3.11,8.93 2.22,9.82 v2.22,53
  Bottom 0.406: v2.22,53 OK101.1
  Bottom 0.61: OK101.1 25.72,53 28.57,55.86 R109.1
N$5
  Top 0.61: OK101.3 28.57,48.88 R108.1
N$6
  Top 1.27: C105.1 33.02,80.62 29.84,83.8 V101.IN
  Bottom 1.27: D102.C 29.84,86.34 V101.IN | C105.1 43.81,80.62 45.4,82.21 C106.+
N$9  (via drill 0.5)
  Top 0.406: v9.21,74.59 v9.21,70.15
  Bottom 0.406: D101.AR v9.21,74.59 | v9.21,70.15 R102.2
N$11
  Bottom 1.016: D201.A D202.C
N$12  (via drill 0.5)
  Top 0.61: RN201.6 65.09,94.28 63.82,93.01 v63.82,67.61
  Top 1.016: D209.A D201.C
  Bottom 1.016: D201.C 58.42,67.29 58.74,67.61 v63.82,67.61 82.55,67.61 90.49,75.55 93.66,75.55 94.61,76.5 X201.3
N$13  (via drill 0.5)
  Top 0.406: v13.65,79.67 v13.65,73.01
  Bottom 0.406: D101.AG v13.65,79.67 | v13.65,73.01 R103.2
N$15
  Bottom 1.016: D217.A D218.C
N$16
  Bottom 1.016: D225.C D226.A
N$17
  Top 0.61: RN201.8 58.42,93.01 D217.C
  Top 1.016: D225.A D217.C
  Bottom 1.016: D217.C 58.42,73.32 58.74,73.64 80.01,73.64 81.92,75.55 81.92,84.44 83.5,86.02 93.66,86.02 94.61,86.98 X201.1
N$18  (via drill 0.5)
  Top 0.61: v85.41,89.52 v85.41,83.8
  Top 1.016: D210.C D202.A D226.C D218.A
  Bottom 0.61: OK201.7 62.55,89.83 62.87,89.52 67.63,89.52 | 67.63,89.52 v85.41,89.52 | OK201.5 67.63,89.52
  Bottom 1.016: X201.2 v85.41,83.8 85.09,83.8 84.14,82.85 84.14,73.64 82.55,72.05 D218.A
N$19
  Bottom 1.016: D204.C D203.A
N$20
  Bottom 1.016: D210.A D209.C
N$21
  Bottom 1.016: D211.C D212.A
N$22  (via drill 0.5)
  Top 0.61: RN201.2 75.25,94.28 73.98,93.01 v73.98,55.54
  Top 1.016: D211.A D203.C
  Bottom 1.016: D203.C 58.42,54.91 59.05,55.54 v73.98,55.54 82.55,55.54 85.09,53 92.08,53 93.03,53.95 93.03,54.59 X202.3
N$31
  Bottom 1.016: D219.A D220.C
N$32
  Bottom 1.016: D227.C D228.A
N$33  (via drill 0.5)
  Top 0.61: RN201.4 70.17,94.28 68.9,93.01 v68.9,88.25 | v66.36,88.25 v66.36,61.57
  Top 1.016: D227.A D219.C
  Bottom 0.61: v68.9,88.25 v66.36,88.25
  Bottom 1.016: D219.C 58.42,61.26 58.74,61.57 v66.36,61.57 88.27,61.57 93.03,66.34 X202.1
N$34  (via drill 0.5)
  Top 0.61: OK201.3 v72.71,88.25 72.71,86.66 71.44,85.39 71.44,74.28 72.71,73.01 v72.71,59.99 | v77.79,88.25 OK201.1
  Top 1.016: D212.C D204.A D228.C D220.A
  Bottom 0.61: v72.71,88.25 v77.79,88.25 | D220.A v72.71,59.99
  Bottom 1.016: X202.2 93.03,61.26 91.76,59.99 D220.A
N$35
  Bottom 1.016: D205.A D206.C
N$36
  Bottom 1.016: D213.C D214.A
N$37  (via drill 0.5)
  Top 0.61: RN202.4 v70.8,22.52 | v63.5,22.52 63.5,38.4 62.55,39.35 D213.A
  Top 1.016: D213.A D205.C
  Bottom 0.61: v70.8,22.52 v63.5,22.52
  Bottom 1.016: D213.A 58.42,38.4 59.05,37.76 89.22,37.76 93.34,33.63 94.3,33.63 X203.3
N$39
  Bottom 1.016: D222.C D221.A
N$40
  Bottom 1.016: D229.C D230.A
N$41  (via drill 0.5)
  Top 0.61: RN202.2 75.88,19.03 74.3,20.62 v74.3,23.79 | v64.77,23.79 64.77,44.43 63.82,45.38 D229.A
  Top 1.016: D229.A D221.C
  Bottom 0.61: v74.3,23.79 v64.77,23.79
  Bottom 1.016: D229.A 58.42,44.43 59.05,43.79 82.87,43.79 86.68,47.6 93.34,47.6 94.61,46.33 X203.1
N$42
  Top 0.61: OK202.8 60.64,14.27 63.18,16.81 RN202.7
N$43
  Top 0.61: OK202.6 65.72,14.27 68.26,16.81 RN202.5
N$44
  Top 0.61: OK202.4 70.8,14.27 73.34,16.81 RN202.3
N$45
  Top 0.61: OK202.2 75.88,14.27 78.42,16.81 RN202.1
N$46
  Top 0.61: OK201.2 75.25,91.42 77.79,93.96 RN201.1
N$48
  Top 0.61: OK201.4 70.17,91.42 72.71,93.96 RN201.3
N$49  (via drill 0.5)
  Top 0.61: OK202.3 v73.34,11.73 | v78.42,11.73 OK202.1 | D214.C 81.92,39.35 82.55,38.71 v82.55,11.73
  Top 1.016: D214.C D206.A D230.C D222.A
  Bottom 0.61: v73.34,11.73 v78.42,11.73 v82.55,11.73
  Bottom 1.016: D214.C 94.3,39.35 X203.2
N$50
  Bottom 1.016: D207.A D208.C
N$51
  Bottom 1.016: D216.A D215.C
N$52
  Top 0.61: RN202.8 60.64,26.33 59.69,27.29 D215.A
  Top 1.016: D215.A D207.C
  Bottom 1.016: D215.A 65.72,27.29 67.31,25.7 80.01,25.7 81.28,24.43 81.28,17.12 82.55,15.86 88.27,15.86 92.71,11.41 X204.3
N$54
  Bottom 1.016: D223.A D224.C
N$55
  Bottom 1.016: D231.C D232.A
N$56  (via drill 0.5)
  Top 0.61: RN202.6 v65.72,21.25 | v62.23,21.25 62.23,32.36 61.28,33.32 D231.A
  Top 1.016: D231.A D223.C
  Bottom 0.61: v65.72,21.25 v62.23,21.25
  Bottom 1.016: D231.A 58.42,32.36 59.05,31.73 84.45,31.73 89.85,26.33 93.34,26.33 94.61,25.06 X204.1
N$57  (via drill 0.5)
  Top 0.61: OK202.7 v63.18,11.73 | v68.26,11.73 OK202.5 | D216.C v80.96,10.46
  Top 1.016: D224.A D232.C 80.96,32.05 80.96,31.41 D208.A D216.C
  Bottom 0.61: v63.18,11.73 v68.26,11.73 69.53,10.46 v80.96,10.46
  Bottom 1.016: D216.C 84.45,27.29 87,24.75 90.49,24.75 91.12,24.11 91.12,18.08 92.71,16.49 X204.2
N$64
  Top 0.61: OK201.6 65.09,91.42 67.63,93.96 RN201.5
N$65
  Top 0.61: OK201.8 60.01,91.42 62.55,93.96 RN201.7
O00  (via drill 0.5)
  Top 0.406: v83.82,87.61 83.82,71.42 v82.87,70.47 | v55.56,70.47 55.56,54.59 52.7,51.73 52.7,50.78 50.48,48.56 IC101.29
  Bottom 0.406: LED201.K v83.82,87.61 | v82.87,70.47 v55.56,70.47
O01  (via drill 0.5)
  Top 0.406: LED205.K 87.95,71.73 84.77,68.56 v84.77,64.75 | v56.52,64.75 56.52,54.27 55.24,53 v55.24,48.24 | v52.7,48.24 50.48,46.02 IC101.28
  Bottom 0.406: v84.77,64.75 v56.52,64.75 | v55.24,48.24 v52.7,48.24
O02  (via drill 0.5)
  Top 0.406: LED202.K 87,65.07 85.72,63.8 85.72,54.59 v83.5,52.37 | v56.52,52.37 v56.52,43.48
  Bottom 0.406: v83.5,52.37 v56.52,52.37 | v56.52,43.48 IC101.27
O03  (via drill 0.5)
  Top 0.406: LED206.K v87.95,49.83 | v53.98,49.83 v53.98,40.94
  Bottom 0.406: v87.95,49.83 v53.98,49.83 | v53.98,40.94 IC101.26
O04  (via drill 0.5)
  Top 0.406: v85.72,42.84 85.72,45.38 84.45,46.65 v83.19,46.65 | v55.24,46.65 v55.24,38.4
  Bottom 0.406: LED203.K v85.72,42.84 | v83.19,46.65 v55.24,46.65 | v55.24,38.4 IC101.25
O05  (via drill 0.5)
  Top 0.406: v85.72,32.68 v85.72,40.94 | v56.52,40.94 v56.52,35.86
  Bottom 0.406: LED207.K v85.72,32.68 | v85.72,40.94 v56.52,40.94 | v56.52,35.86 IC101.24
O06  (via drill 0.5)
  Top 0.406: v84.77,20.3 v84.77,34.59 | v56.52,34.59 v56.52,33.32
  Bottom 0.406: LED204.K v84.77,20.3 | v84.77,34.59 v56.52,34.59 | v56.52,33.32 IC101.23
O07  (via drill 0.5)
  Top 0.406: v83.82,10.14 v83.82,28.87
  Bottom 0.406: LED208.K v83.82,10.14 | v83.82,28.87 57.47,28.87 55.56,30.78 IC101.22
PLUGGED  (via drill 0.5)
  Top 0.406: v12.7,71.73 12.7,83.48 10.89,85.3 10.48,85.3 CON101.3
  Bottom 0.406: IC101.39 37.15,73.96 35.88,72.69 31.75,72.69 30.8,71.73 v12.7,71.73
Q-CLK
  Top 0.813: IC104.8 29.53,27.29 QG101.8 28.89,29.19 31.43,31.73 31.43,45.38 32.07,46.02 IC101.13
SCK  (via drill 0.5)
  Top 0.406: IC104.13 34.61,17.76 35.88,19.03 35.88,58.4 35.56,58.72 IC101.8 | IC103.6 42.23,7.28 41.27,8.24 v41.27,9.19
  Bottom 0.406: SV101.3 51.12,11.09 49.21,9.19 v41.27,9.19 34.29,9.19 33.34,10.14 33.34,14.59 IC104.13
SPG
  Bottom 0.406: R107.1 R106.2 53.02,82.53 48.9,78.4 IC101.40
V-NETZTEIL1
  Bottom 1.27: CON101.1 19.05,90.47 21.91,93.33 D103.A

### Text on the board
Bottom: MBCAN-Projekt | (c) Dr.-Ing. Th. Wiesner | 06.01.2024 | mbc88dc.brd | bottom
tNames: HW: 24.01.06 | +18V | DC | B | Status | (c) Dr.-Ing. Th. Wiesner | MBCAN-Projekt | B | IN | B | OUT | B | mbc-88-DC